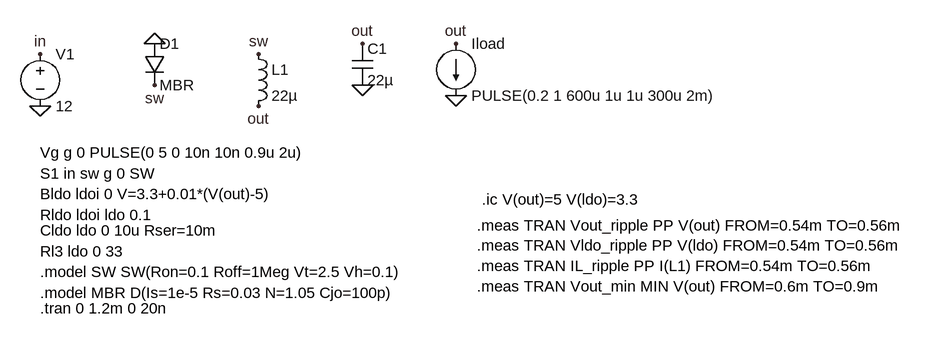
[diagram p0: schematic buck_ldo.asc]
buck_ldo.asc, the LTspice schematic file:
Version 4.1
SHEET 1 1452 640
FLAG 80 176 in
FLAG 80 256 0
FLAG 256 160 0
FLAG 256 224 sw
FLAG 416 176 sw
FLAG 416 256 out
FLAG 576 160 out
FLAG 576 224 0
FLAG 720 160 out
FLAG 720 240 0
SYMBOL voltage 80 160 R0
SYMATTR InstName V1
SYMATTR Value 12
SYMBOL diode 240 160 R0
SYMATTR InstName D1
SYMATTR Value MBR
SYMBOL ind 400 160 R0
SYMATTR InstName L1
SYMATTR Value 22µ
SYMATTR SpiceLine Rser=30m
SYMBOL cap 560 160 R0
SYMATTR InstName C1
SYMATTR Value 22µ
SYMATTR SpiceLine Rser=5m
SYMBOL current 720 160 R0
SYMATTR InstName Iload
SYMATTR Value PULSE(0.2 1 600u 1u 1u 300u 2m)
TEXT 80 328 Left 2 !Vg g 0 PULSE(0 5 0 10n 10n 0.9u 2u)
TEXT 80 360 Left 2 !S1 in sw g 0 SW
TEXT 80 392 Left 2 !Bldo ldoi 0 V=3.3+0.01*(V(out)-5)
TEXT 80 424 Left 2 !Rldo ldoi ldo 0.1
TEXT 80 448 Left 2 !Cldo ldo 0 10u Rser=10m
TEXT 80 480 Left 2 !Rl3 ldo 0 33
TEXT 80 512 Left 2 !.model SW SW(Ron=0.1 Roff=1Meg Vt=2.5 Vh=0.1)
TEXT 80 544 Left 2 !.model MBR D(Is=1e-5 Rs=0.03 N=1.05 Cjo=100p)
TEXT 80 568 Left 2 !.tran 0 1.2m 0 20n
TEXT 760 400 Left 2 !.ic V(out)=5 V(ldo)=3.3
TEXT 752 440 Left 2 !.meas TRAN Vout_ripple PP V(out) FROM=0.54m TO=0.56m\n.meas TRAN Vldo_ripple PP V(ldo) FROM=0.54m TO=0.56m\n.meas TRAN IL_ripple PP I(L1) FROM=0.54m TO=0.56m\n.meas TRAN Vout_min MIN V(out) FROM=0.6m TO=0.9m

The netlist it stands for:
* buck_ldo.asc
V1 in 0 12
D1 0 sw MBR
L1 sw out 22µ Rser=30m
C1 out 0 22µ Rser=5m
Iload out 0 PULSE(0.2 1 600u 1u 1u 300u 2m)
.model D D
.lib standard.dio
Vg g 0 PULSE(0 5 0 10n 10n 0.9u 2u)
S1 in sw g 0 SW
Bldo ldoi 0 V=3.3+0.01*(V(out)-5)
Rldo ldoi ldo 0.1
Cldo ldo 0 10u Rser=10m
Rl3 ldo 0 33
.model SW SW(Ron=0.1 Roff=1Meg Vt=2.5 Vh=0.1)
.model MBR D(Is=1e-5 Rs=0.03 N=1.05 Cjo=100p)
.tran 0 1.2m 0 20n
.ic V(out)=5 V(ldo)=3.3
.meas TRAN Vout_ripple PP V(out) FROM=0.54m TO=0.56m
.meas TRAN Vldo_ripple PP V(ldo) FROM=0.54m TO=0.56m
.meas TRAN IL_ripple PP I(L1) FROM=0.54m TO=0.56m
.meas TRAN Vout_min MIN V(out) FROM=0.6m TO=0.9m
.backanno
.end